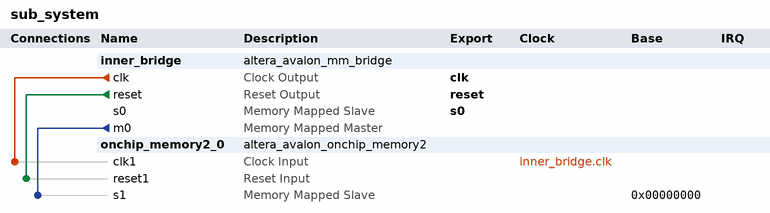
[diagram p0: system contents]
# Platform Designer (Qsys) system sub_system
# Parameters at their usual value, and those the tool derives, are not listed.
package require -exact qsys 18.1
create_system sub_system
set_project_property DEVICE_FAMILY {Cyclone V}

add_instance inner_bridge altera_avalon_mm_bridge 18.1
set_instance_parameter_value inner_bridge DATA_WIDTH 32

add_instance onchip_memory2_0 altera_avalon_onchip_memory2 18.1
set_instance_parameter_value onchip_memory2_0 memorySize 4096

# connections
add_connection inner_bridge.clk onchip_memory2_0.clk1 clock
add_connection inner_bridge.reset onchip_memory2_0.reset1 reset
add_connection inner_bridge.m0 onchip_memory2_0.s1 avalon
set_connection_parameter_value inner_bridge.m0/onchip_memory2_0.s1 baseAddress 0x00000000

# exported interfaces
add_interface clk clock sink
set_interface_property clk EXPORT_OF inner_bridge.clk
add_interface reset reset sink
set_interface_property reset EXPORT_OF inner_bridge.reset
add_interface s0 avalon slave
set_interface_property s0 EXPORT_OF inner_bridge.s0

save_system sub_system.qsys
